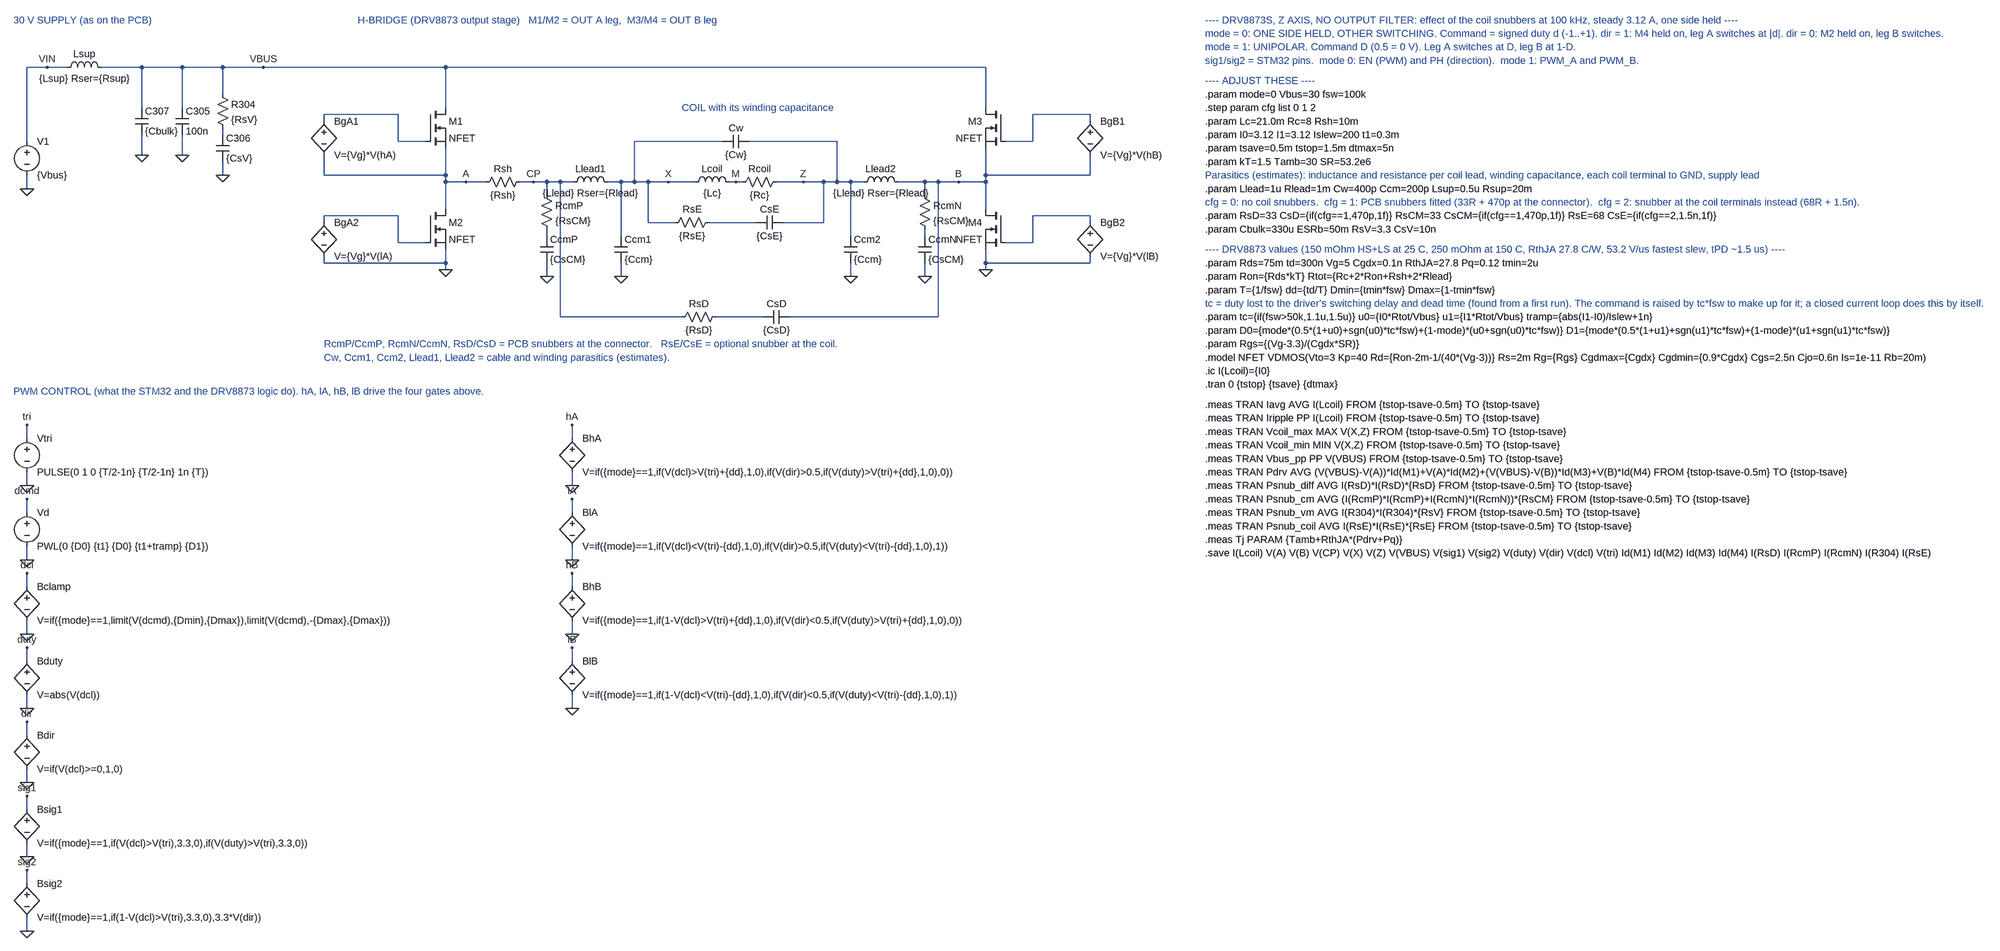
[diagram p0: schematic sim_C_snubber_100k.asc]
sim_C_snubber_100k.asc, the LTspice schematic file:
Version 4.1
SHEET 1 5200 2700
WIRE -992 176 -992 0
WIRE -992 0 -896 0
WIRE -992 256 -992 288
WIRE -816 0 1280 0
WIRE -720 0 -720 96
WIRE -720 160 -720 208
WIRE -624 0 -624 96
WIRE -624 160 -624 208
WIRE -528 0 -528 64
WIRE -528 144 -528 160
WIRE -528 224 -528 256
WIRE 0 0 0 96
WIRE 0 192 0 256
WIRE 0 256 0 272
WIRE 0 272 0 336
WIRE 0 432 0 464
WIRE 0 464 0 480
WIRE -48 176 -112 176
WIRE -112 176 -112 112
WIRE -112 112 -288 112
WIRE -288 112 -288 128
WIRE -288 208 -288 256
WIRE -288 256 0 256
WIRE -48 416 -112 416
WIRE -112 416 -112 352
WIRE -112 352 -288 352
WIRE -288 352 -288 368
WIRE -288 448 -288 464
WIRE -288 464 0 464
WIRE 1280 0 1280 96
WIRE 1280 192 1280 256
WIRE 1280 256 1280 272
WIRE 1280 272 1280 336
WIRE 1280 432 1280 464
WIRE 1280 464 1280 480
WIRE 1328 176 1392 176
WIRE 1392 176 1392 112
WIRE 1392 112 1568 112
WIRE 1568 112 1568 128
WIRE 1568 208 1568 256
WIRE 1568 256 1280 256
WIRE 1328 416 1392 416
WIRE 1392 416 1392 352
WIRE 1392 352 1568 352
WIRE 1568 352 1568 368
WIRE 1568 448 1568 464
WIRE 1568 464 1280 464
WIRE 0 272 96 272
WIRE 176 272 304 272
WIRE 384 272 592 272
WIRE 672 272 704 272
WIRE 784 272 992 272
WIRE 1072 272 1280 272
WIRE 448 272 448 176
WIRE 448 176 656 176
WIRE 720 176 928 176
WIRE 928 176 928 272
WIRE 480 272 480 368
WIRE 480 368 544 368
WIRE 624 368 736 368
WIRE 800 368 896 368
WIRE 896 368 896 272
WIRE 416 272 416 400
WIRE 416 464 416 496
WIRE 960 272 960 400
WIRE 960 464 960 496
WIRE 240 272 240 304
WIRE 240 384 240 400
WIRE 240 464 240 496
WIRE 1136 272 1136 304
WIRE 1136 384 1136 400
WIRE 1136 464 1136 496
WIRE 272 272 272 592
WIRE 272 592 560 592
WIRE 640 592 752 592
WIRE 816 592 1168 592
WIRE 1168 592 1168 272
WIRE -992 880 -992 848
WIRE -992 960 -992 992
WIRE -992 1056 -992 1024
WIRE -992 1136 -992 1168
WIRE -992 1232 -992 1200
WIRE -992 1312 -992 1344
WIRE -992 1408 -992 1376
WIRE -992 1488 -992 1520
WIRE -992 1584 -992 1552
WIRE -992 1664 -992 1696
WIRE -992 1760 -992 1728
WIRE -992 1840 -992 1872
WIRE -992 1936 -992 1904
WIRE -992 2016 -992 2048
WIRE 300 880 300 848
WIRE 300 960 300 992
WIRE 300 1056 300 1024
WIRE 300 1136 300 1168
WIRE 300 1232 300 1200
WIRE 300 1312 300 1344
WIRE 300 1408 300 1376
WIRE 300 1488 300 1520
FLAG -992 288 0
FLAG -944 0 VIN
FLAG -432 0 VBUS
FLAG -720 208 0
FLAG -624 208 0
FLAG -528 256 0
FLAG 0 480 0
FLAG 1280 480 0
FLAG 48 272 A
FLAG 208 272 CP
FLAG 528 272 X
FLAG 688 272 M
FLAG 848 272 Z
FLAG 1216 272 B
FLAG 416 496 0
FLAG 960 496 0
FLAG 240 496 0
FLAG 1136 496 0
FLAG -992 848 tri
FLAG -992 992 0
FLAG -992 1024 dcmd
FLAG -992 1168 0
FLAG -992 1200 dcl
FLAG -992 1344 0
FLAG -992 1376 duty
FLAG -992 1520 0
FLAG -992 1552 dir
FLAG -992 1696 0
FLAG -992 1728 sig1
FLAG -992 1872 0
FLAG -992 1904 sig2
FLAG -992 2048 0
FLAG 300 848 hA
FLAG 300 992 0
FLAG 300 1024 lA
FLAG 300 1168 0
FLAG 300 1200 hB
FLAG 300 1344 0
FLAG 300 1376 lB
FLAG 300 1520 0
SYMBOL voltage -992 160 R0
SYMATTR InstName V1
SYMATTR Value {Vbus}
SYMBOL ind -912 16 R270
WINDOW 0 32 56 VTop 2
WINDOW 3 5 56 VBottom 2
SYMATTR InstName Lsup
SYMATTR Value {Lsup} Rser={Rsup}
SYMBOL cap -736 96 R0
SYMATTR InstName C307
SYMATTR Value {Cbulk}
SYMATTR SpiceLine Rser={ESRb}
SYMBOL cap -640 96 R0
SYMATTR InstName C305
SYMATTR Value 100n
SYMATTR SpiceLine Rser=5m
SYMBOL res -544 48 R0
SYMATTR InstName R304
SYMATTR Value {RsV}
SYMBOL cap -544 160 R0
SYMATTR InstName C306
SYMATTR Value {CsV}
SYMBOL nmos -48 96 R0
SYMATTR InstName M1
SYMATTR Value NFET
SYMBOL nmos -48 336 R0
SYMATTR InstName M2
SYMATTR Value NFET
SYMBOL bv -288 112 R0
SYMATTR InstName BgA1
SYMATTR Value V={Vg}*V(hA)
SYMBOL bv -288 352 R0
SYMATTR InstName BgA2
SYMATTR Value V={Vg}*V(lA)
SYMBOL nmos 1328 96 M0
SYMATTR InstName M3
SYMATTR Value NFET
SYMBOL nmos 1328 336 M0
SYMATTR InstName M4
SYMATTR Value NFET
SYMBOL bv 1568 112 R0
SYMATTR InstName BgB1
SYMATTR Value V={Vg}*V(hB)
SYMBOL bv 1568 352 R0
SYMATTR InstName BgB2
SYMATTR Value V={Vg}*V(lB)
SYMBOL res 80 288 R270
WINDOW 0 32 56 VTop 2
WINDOW 3 0 56 VBottom 2
SYMATTR InstName Rsh
SYMATTR Value {Rsh}
SYMBOL ind 288 288 R270
WINDOW 0 32 56 VTop 2
WINDOW 3 5 56 VBottom 2
SYMATTR InstName Llead1
SYMATTR Value {Llead} Rser={Rlead}
SYMBOL ind 576 288 R270
WINDOW 0 32 56 VTop 2
WINDOW 3 5 56 VBottom 2
SYMATTR InstName Lcoil
SYMATTR Value {Lc}
SYMBOL res 688 288 R270
WINDOW 0 32 56 VTop 2
WINDOW 3 0 56 VBottom 2
SYMATTR InstName Rcoil
SYMATTR Value {Rc}
SYMBOL ind 976 288 R270
WINDOW 0 32 56 VTop 2
WINDOW 3 5 56 VBottom 2
SYMATTR InstName Llead2
SYMATTR Value {Llead} Rser={Rlead}
SYMBOL cap 656 192 R270
WINDOW 0 32 32 VTop 2
WINDOW 3 0 32 VBottom 2
SYMATTR InstName Cw
SYMATTR Value {Cw}
SYMBOL res 528 384 R270
WINDOW 0 32 56 VTop 2
WINDOW 3 0 56 VBottom 2
SYMATTR InstName RsE
SYMATTR Value {RsE}
SYMBOL cap 736 384 R270
WINDOW 0 32 32 VTop 2
WINDOW 3 0 32 VBottom 2
SYMATTR InstName CsE
SYMATTR Value {CsE}
SYMBOL cap 400 400 R0
SYMATTR InstName Ccm1
SYMATTR Value {Ccm}
SYMBOL cap 944 400 R0
SYMATTR InstName Ccm2
SYMATTR Value {Ccm}
SYMBOL res 224 288 R0
SYMATTR InstName RcmP
SYMATTR Value {RsCM}
SYMBOL cap 224 400 R0
SYMATTR InstName CcmP
SYMATTR Value {CsCM}
SYMBOL res 1120 288 R0
SYMATTR InstName RcmN
SYMATTR Value {RsCM}
SYMBOL cap 1120 400 R0
SYMATTR InstName CcmN
SYMATTR Value {CsCM}
SYMBOL res 544 608 R270
WINDOW 0 32 56 VTop 2
WINDOW 3 0 56 VBottom 2
SYMATTR InstName RsD
SYMATTR Value {RsD}
SYMBOL cap 752 608 R270
WINDOW 0 32 32 VTop 2
WINDOW 3 0 32 VBottom 2
SYMATTR InstName CsD
SYMATTR Value {CsD}
SYMBOL voltage -992 864 R0
SYMATTR InstName Vtri
SYMATTR Value PULSE(0 1 0 {T/2-1n} {T/2-1n} 1n {T})
SYMBOL voltage -992 1040 R0
SYMATTR InstName Vd
SYMATTR Value PWL(0 {D0} {t1} {D0} {t1+tramp} {D1})
SYMBOL bv -992 1216 R0
SYMATTR InstName Bclamp
SYMATTR Value V=if({mode}==1,limit(V(dcmd),{Dmin},{Dmax}),limit(V(dcmd),-{Dmax},{Dmax}))
SYMBOL bv -992 1392 R0
SYMATTR InstName Bduty
SYMATTR Value V=abs(V(dcl))
SYMBOL bv -992 1568 R0
SYMATTR InstName Bdir
SYMATTR Value V=if(V(dcl)>=0,1,0)
SYMBOL bv -992 1744 R0
SYMATTR InstName Bsig1
SYMATTR Value V=if({mode}==1,if(V(dcl)>V(tri),3.3,0),if(V(duty)>V(tri),3.3,0))
SYMBOL bv -992 1920 R0
SYMATTR InstName Bsig2
SYMATTR Value V=if({mode}==1,if(1-V(dcl)>V(tri),3.3,0),3.3*V(dir))
SYMBOL bv 300 864 R0
SYMATTR InstName BhA
SYMATTR Value V=if({mode}==1,if(V(dcl)>V(tri)+{dd},1,0),if(V(dir)>0.5,if(V(duty)>V(tri)+{dd},1,0),0))
SYMBOL bv 300 1040 R0
SYMATTR InstName BlA
SYMATTR Value V=if({mode}==1,if(V(dcl)<V(tri)-{dd},1,0),if(V(dir)>0.5,if(V(duty)<V(tri)-{dd},1,0),1))
SYMBOL bv 300 1216 R0
SYMATTR InstName BhB
SYMATTR Value V=if({mode}==1,if(1-V(dcl)>V(tri)+{dd},1,0),if(V(dir)<0.5,if(V(duty)>V(tri)+{dd},1,0),0))
SYMBOL bv 300 1392 R0
SYMATTR InstName BlB
SYMATTR Value V=if({mode}==1,if(1-V(dcl)<V(tri)-{dd},1,0),if(V(dir)<0.5,if(V(duty)<V(tri)-{dd},1,0),1))
TEXT -1024 -112 Left 2 ;30 V SUPPLY (as on the PCB)
TEXT -208 -112 Left 2 ;H-BRIDGE (DRV8873 output stage)   M1/M2 = OUT A leg,  M3/M4 = OUT B leg
TEXT 560 96 Left 2 ;COIL with its winding capacitance
TEXT -288 656 Left 2 ;RcmP/CcmP, RcmN/CcmN, RsD/CsD = PCB snubbers at the connector.   RsE/CsE = optional snubber at the coil.
TEXT -288 688 Left 2 ;Cw, Ccm1, Ccm2, Llead1, Llead2 = cable and winding parasitics (estimates).
TEXT -1024 768 Left 2 ;PWM CONTROL (what the STM32 and the DRV8873 logic do). hA, lA, hB, lB drive the four gates above.
TEXT 2000 -112 Left 2 ;---- DRV8873S, Z AXIS, NO OUTPUT FILTER: effect of the coil snubbers at 100 kHz, steady 3.12 A, one side held ----
TEXT 2000 -80 Left 2 ;mode = 0: ONE SIDE HELD, OTHER SWITCHING. Command = signed duty d (-1..+1). dir = 1: M4 held on, leg A switches at |d|. dir = 0: M2 held on, leg B switches.
TEXT 2000 -48 Left 2 ;mode = 1: UNIPOLAR. Command D (0.5 = 0 V). Leg A switches at D, leg B at 1-D.
TEXT 2000 -16 Left 2 ;sig1/sig2 = STM32 pins.  mode 0: EN (PWM) and PH (direction).  mode 1: PWM_A and PWM_B.
TEXT 2000 32 Left 2 ;---- ADJUST THESE ----
TEXT 2000 64 Left 2 !.param mode=0 Vbus=30 fsw=100k
TEXT 2000 96 Left 2 !.step param cfg list 0 1 2
TEXT 2000 128 Left 2 !.param Lc=21.0m Rc=8 Rsh=10m
TEXT 2000 160 Left 2 !.param I0=3.12 I1=3.12 Islew=200 t1=0.3m
TEXT 2000 192 Left 2 !.param tsave=0.5m tstop=1.5m dtmax=5n
TEXT 2000 224 Left 2 !.param kT=1.5 Tamb=30 SR=53.2e6
TEXT 2000 256 Left 2 ;Parasitics (estimates): inductance and resistance per coil lead, winding capacitance, each coil terminal to GND, supply lead
TEXT 2000 288 Left 2 !.param Llead=1u Rlead=1m Cw=400p Ccm=200p Lsup=0.5u Rsup=20m
TEXT 2000 320 Left 2 ;cfg = 0: no coil snubbers.  cfg = 1: PCB snubbers fitted (33R + 470p at the connector).  cfg = 2: snubber at the coil terminals instead (68R + 1.5n).
TEXT 2000 352 Left 2 !.param RsD=33 CsD={if(cfg==1,470p,1f)} RsCM=33 CsCM={if(cfg==1,470p,1f)} RsE=68 CsE={if(cfg==2,1.5n,1f)}
TEXT 2000 384 Left 2 !.param Cbulk=330u ESRb=50m RsV=3.3 CsV=10n
TEXT 2000 432 Left 2 ;---- DRV8873 values (150 mOhm HS+LS at 25 C, 250 mOhm at 150 C, RthJA 27.8 C/W, 53.2 V/us fastest slew, tPD ~1.5 us) ----
TEXT 2000 464 Left 2 !.param Rds=75m td=300n Vg=5 Cgdx=0.1n RthJA=27.8 Pq=0.12 tmin=2u
TEXT 2000 496 Left 2 !.param Ron={Rds*kT} Rtot={Rc+2*Ron+Rsh+2*Rlead}
TEXT 2000 528 Left 2 !.param T={1/fsw} dd={td/T} Dmin={tmin*fsw} Dmax={1-tmin*fsw}
TEXT 2000 560 Left 2 ;tc = duty lost to the driver's switching delay and dead time (found from a first run). The command is raised by tc*fsw to make up for it; a closed current loop does this by itself.
TEXT 2000 592 Left 2 !.param tc={if(fsw>50k,1.1u,1.5u)} u0={I0*Rtot/Vbus} u1={I1*Rtot/Vbus} tramp={abs(I1-I0)/Islew+1n}
TEXT 2000 624 Left 2 !.param D0={mode*(0.5*(1+u0)+sgn(u0)*tc*fsw)+(1-mode)*(u0+sgn(u0)*tc*fsw)} D1={mode*(0.5*(1+u1)+sgn(u1)*tc*fsw)+(1-mode)*(u1+sgn(u1)*tc*fsw)}
TEXT 2000 656 Left 2 !.param Rgs={(Vg-3.3)/(Cgdx*SR)}
TEXT 2000 688 Left 2 !.model NFET VDMOS(Vto=3 Kp=40 Rd={Ron-2m-1/(40*(Vg-3))} Rs=2m Rg={Rgs} Cgdmax={Cgdx} Cgdmin={0.9*Cgdx} Cgs=2.5n Cjo=0.6n Is=1e-11 Rb=20m)
TEXT 2000 720 Left 2 !.ic I(Lcoil)={I0}
TEXT 2000 752 Left 2 !.tran 0 {tstop} {tsave} {dtmax}
TEXT 2000 800 Left 2 !.meas TRAN Iavg AVG I(Lcoil) FROM {tstop-tsave-0.5m} TO {tstop-tsave}
TEXT 2000 832 Left 2 !.meas TRAN Iripple PP I(Lcoil) FROM {tstop-tsave-0.5m} TO {tstop-tsave}
TEXT 2000 864 Left 2 !.meas TRAN Vcoil_max MAX V(X,Z) FROM {tstop-tsave-0.5m} TO {tstop-tsave}
TEXT 2000 896 Left 2 !.meas TRAN Vcoil_min MIN V(X,Z) FROM {tstop-tsave-0.5m} TO {tstop-tsave}
TEXT 2000 928 Left 2 !.meas TRAN Vbus_pp PP V(VBUS) FROM {tstop-tsave-0.5m} TO {tstop-tsave}
TEXT 2000 960 Left 2 !.meas TRAN Pdrv AVG (V(VBUS)-V(A))*Id(M1)+V(A)*Id(M2)+(V(VBUS)-V(B))*Id(M3)+V(B)*Id(M4) FROM {tstop-tsave-0.5m} TO {tstop-tsave}
TEXT 2000 992 Left 2 !.meas TRAN Psnub_diff AVG I(RsD)*I(RsD)*{RsD} FROM {tstop-tsave-0.5m} TO {tstop-tsave}
TEXT 2000 1024 Left 2 !.meas TRAN Psnub_cm AVG (I(RcmP)*I(RcmP)+I(RcmN)*I(RcmN))*{RsCM} FROM {tstop-tsave-0.5m} TO {tstop-tsave}
TEXT 2000 1056 Left 2 !.meas TRAN Psnub_vm AVG I(R304)*I(R304)*{RsV} FROM {tstop-tsave-0.5m} TO {tstop-tsave}
TEXT 2000 1088 Left 2 !.meas TRAN Psnub_coil AVG I(RsE)*I(RsE)*{RsE} FROM {tstop-tsave-0.5m} TO {tstop-tsave}
TEXT 2000 1120 Left 2 !.meas Tj PARAM {Tamb+RthJA*(Pdrv+Pq)}
TEXT 2000 1152 Left 2 !.save I(Lcoil) V(A) V(B) V(CP) V(X) V(Z) V(VBUS) V(sig1) V(sig2) V(duty) V(dir) V(dcl) V(tri) Id(M1) Id(M2) Id(M3) Id(M4) I(RsD) I(RcmP) I(RcmN) I(R304) I(RsE)

The netlist it stands for:
* sim_C_snubber_100k.asc
V1 VIN 0 {Vbus}
Lsup VIN VBUS {Lsup} Rser={Rsup}
C307 VBUS 0 {Cbulk} Rser={ESRb}
C305 VBUS 0 100n Rser=5m
R304 VBUS N001 {RsV}
C306 N001 0 {CsV}
M1 VBUS N002 A A NFET
M2 A N003 0 0 NFET
BgA1 N002 A V={Vg}*V(hA)
BgA2 N003 0 V={Vg}*V(lA)
M3 VBUS N004 B B NFET
M4 B N005 0 0 NFET
BgB1 N004 B V={Vg}*V(hB)
BgB2 N005 0 V={Vg}*V(lB)
Rsh A CP {Rsh}
Llead1 CP X {Llead} Rser={Rlead}
Lcoil X M {Lc}
Rcoil M Z {Rc}
Llead2 Z B {Llead} Rser={Rlead}
Cw X Z {Cw}
RsE X N006 {RsE}
CsE N006 Z {CsE}
Ccm1 X 0 {Ccm}
Ccm2 Z 0 {Ccm}
RcmP CP N007 {RsCM}
CcmP N007 0 {CsCM}
RcmN B N008 {RsCM}
CcmN N008 0 {CsCM}
RsD CP N009 {RsD}
CsD N009 B {CsD}
Vtri tri 0 PULSE(0 1 0 {T/2-1n} {T/2-1n} 1n {T})
Vd dcmd 0 PWL(0 {D0} {t1} {D0} {t1+tramp} {D1})
Bclamp dcl 0 V=if({mode}==1,limit(V(dcmd),{Dmin},{Dmax}),limit(V(dcmd),-{Dmax},{Dmax}))
Bduty duty 0 V=abs(V(dcl))
Bdir dir 0 V=if(V(dcl)>=0,1,0)
Bsig1 sig1 0 V=if({mode}==1,if(V(dcl)>V(tri),3.3,0),if(V(duty)>V(tri),3.3,0))
Bsig2 sig2 0 V=if({mode}==1,if(1-V(dcl)>V(tri),3.3,0),3.3*V(dir))
BhA hA 0 V=if({mode}==1,if(V(dcl)>V(tri)+{dd},1,0),if(V(dir)>0.5,if(V(duty)>V(tri)+{dd},1,0),0))
BlA lA 0 V=if({mode}==1,if(V(dcl)<V(tri)-{dd},1,0),if(V(dir)>0.5,if(V(duty)<V(tri)-{dd},1,0),1))
BhB hB 0 V=if({mode}==1,if(1-V(dcl)>V(tri)+{dd},1,0),if(V(dir)<0.5,if(V(duty)>V(tri)+{dd},1,0),0))
BlB lB 0 V=if({mode}==1,if(1-V(dcl)<V(tri)-{dd},1,0),if(V(dir)<0.5,if(V(duty)<V(tri)-{dd},1,0),1))
.model NMOS NMOS
.model PMOS PMOS
.lib standard.mos
* 30 V SUPPLY (as on the PCB)
* H-BRIDGE (DRV8873 output stage)   M1/M2 = OUT A leg,  M3/M4 = OUT B leg
* COIL with its winding capacitance
* RcmP/CcmP, RcmN/CcmN, RsD/CsD = PCB snubbers at the connector.   RsE/CsE = optional snubber at the coil.
* Cw, Ccm1, Ccm2, Llead1, Llead2 = cable and winding parasitics (estimates).
* PWM CONTROL (what the STM32 and the DRV8873 logic do). hA, lA, hB, lB drive the four gates above.
* ---- DRV8873S, Z AXIS, NO OUTPUT FILTER: effect of the coil snubbers at 100 kHz, steady 3.12 A, one side held ----
* mode = 0: ONE SIDE HELD, OTHER SWITCHING. Command = signed duty d (-1..+1). dir = 1: M4 held on, leg A switches at |d|. dir = 0: M2 held on, leg B switches.
* mode = 1: UNIPOLAR. Command D (0.5 = 0 V). Leg A switches at D, leg B at 1-D.
* sig1/sig2 = STM32 pins.  mode 0: EN (PWM) and PH (direction).  mode 1: PWM_A and PWM_B.
* ---- ADJUST THESE ----
.param mode=0 Vbus=30 fsw=100k
.step param cfg list 0 1 2
.param Lc=21.0m Rc=8 Rsh=10m
.param I0=3.12 I1=3.12 Islew=200 t1=0.3m
.param tsave=0.5m tstop=1.5m dtmax=5n
.param kT=1.5 Tamb=30 SR=53.2e6
* Parasitics (estimates): inductance and resistance per coil lead, winding capacitance, each coil terminal to GND, supply lead
.param Llead=1u Rlead=1m Cw=400p Ccm=200p Lsup=0.5u Rsup=20m
* cfg = 0: no coil snubbers.  cfg = 1: PCB snubbers fitted (33R + 470p at the connector).  cfg = 2: snubber at the coil terminals instead (68R + 1.5n).
.param RsD=33 CsD={if(cfg==1,470p,1f)} RsCM=33 CsCM={if(cfg==1,470p,1f)} RsE=68 CsE={if(cfg==2,1.5n,1f)}
.param Cbulk=330u ESRb=50m RsV=3.3 CsV=10n
* ---- DRV8873 values (150 mOhm HS+LS at 25 C, 250 mOhm at 150 C, RthJA 27.8 C/W, 53.2 V/us fastest slew, tPD ~1.5 us) ----
.param Rds=75m td=300n Vg=5 Cgdx=0.1n RthJA=27.8 Pq=0.12 tmin=2u
.param Ron={Rds*kT} Rtot={Rc+2*Ron+Rsh+2*Rlead}
.param T={1/fsw} dd={td/T} Dmin={tmin*fsw} Dmax={1-tmin*fsw}
* tc = duty lost to the driver's switching delay and dead time (found from a first run). The command is raised by tc*fsw to make up for it; a closed current loop does this by itself.
.param tc={if(fsw>50k,1.1u,1.5u)} u0={I0*Rtot/Vbus} u1={I1*Rtot/Vbus} tramp={abs(I1-I0)/Islew+1n}
.param D0={mode*(0.5*(1+u0)+sgn(u0)*tc*fsw)+(1-mode)*(u0+sgn(u0)*tc*fsw)} D1={mode*(0.5*(1+u1)+sgn(u1)*tc*fsw)+(1-mode)*(u1+sgn(u1)*tc*fsw)}
.param Rgs={(Vg-3.3)/(Cgdx*SR)}
.model NFET VDMOS(Vto=3 Kp=40 Rd={Ron-2m-1/(40*(Vg-3))} Rs=2m Rg={Rgs} Cgdmax={Cgdx} Cgdmin={0.9*Cgdx} Cgs=2.5n Cjo=0.6n Is=1e-11 Rb=20m)
.ic I(Lcoil)={I0}
.tran 0 {tstop} {tsave} {dtmax}
.meas TRAN Iavg AVG I(Lcoil) FROM {tstop-tsave-0.5m} TO {tstop-tsave}
.meas TRAN Iripple PP I(Lcoil) FROM {tstop-tsave-0.5m} TO {tstop-tsave}
.meas TRAN Vcoil_max MAX V(X,Z) FROM {tstop-tsave-0.5m} TO {tstop-tsave}
.meas TRAN Vcoil_min MIN V(X,Z) FROM {tstop-tsave-0.5m} TO {tstop-tsave}
.meas TRAN Vbus_pp PP V(VBUS) FROM {tstop-tsave-0.5m} TO {tstop-tsave}
.meas TRAN Pdrv AVG (V(VBUS)-V(A))*Id(M1)+V(A)*Id(M2)+(V(VBUS)-V(B))*Id(M3)+V(B)*Id(M4) FROM {tstop-tsave-0.5m} TO {tstop-tsave}
.meas TRAN Psnub_diff AVG I(RsD)*I(RsD)*{RsD} FROM {tstop-tsave-0.5m} TO {tstop-tsave}
.meas TRAN Psnub_cm AVG (I(RcmP)*I(RcmP)+I(RcmN)*I(RcmN))*{RsCM} FROM {tstop-tsave-0.5m} TO {tstop-tsave}
.meas TRAN Psnub_vm AVG I(R304)*I(R304)*{RsV} FROM {tstop-tsave-0.5m} TO {tstop-tsave}
.meas TRAN Psnub_coil AVG I(RsE)*I(RsE)*{RsE} FROM {tstop-tsave-0.5m} TO {tstop-tsave}
.meas Tj PARAM {Tamb+RthJA*(Pdrv+Pq)}
.save I(Lcoil) V(A) V(B) V(CP) V(X) V(Z) V(VBUS) V(sig1) V(sig2) V(duty) V(dir) V(dcl) V(tri) Id(M1) Id(M2) Id(M3) Id(M4) I(RsD) I(RcmP) I(RcmN) I(R304) I(RsE)
.backanno
.end